# Altium schematic sheet STM32.SchDoc
size A4; SheetNumber: 4; SheetTotal: 6
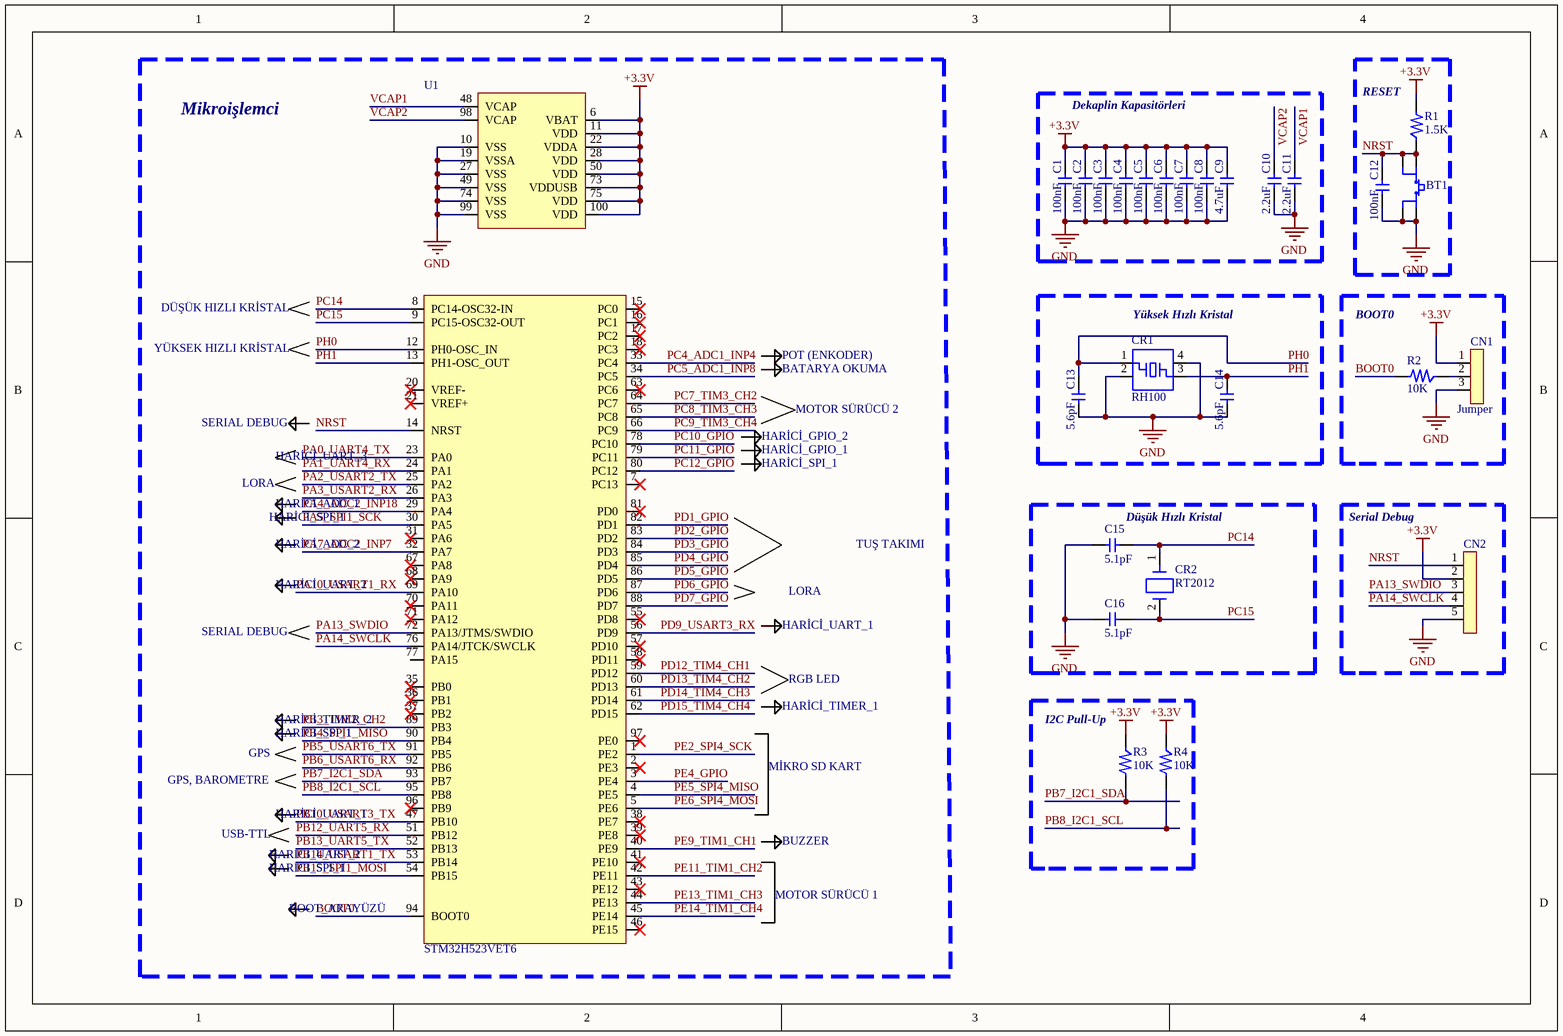
[diagram p0: STM32.SchDoc]

## Parts
BT1  5_mm_Buton  [5mm_buton]  (value not drawn)
C1  value 100nF  [CAP_0603]  (hidden comment: CAP_0603)
C2  value 100nF  [CAP_0603]  (hidden comment: CAP_0603)
C3  value 100nF  [CAP_0603]  (hidden comment: CAP_0603)
C4  value 100nF  [CAP_0603]  (hidden comment: CAP_0603)
C5  value 100nF  [CAP_0603]  (hidden comment: CAP_0603)
C6  value 100nF  [CAP_0603]  (hidden comment: CAP_0603)
C7  value 100nF  [CAP_0603]  (hidden comment: CAP_0603)
C8  value 100nF  [CAP_0603]  (hidden comment: CAP_0603)
C9  value 4.7uF  [CAP_0603]  (hidden comment: CAP_0603)
C10  value 2.2uF  [CAP_0603]  (hidden comment: CAP_0603)
C11  value 2.2uF  [CAP_0603]  (hidden comment: CAP_0603)
C12  value 100nF  [CAP_0603]  (hidden comment: CAP_0603)
C13  value 5.6pF  [CAP_0603]  (hidden comment: CAP_0603)
C14  value 5.6pF  [CAP_0603]  (hidden comment: CAP_0603)
C15  value 5.1pF  [CAP_0603]  (hidden comment: CAP_0603)
C16  value 5.1pF  [CAP_0603]  (hidden comment: CAP_0603)
CN1  Jumper  [3_PIN_HEADER]
CN2  5_Pin_Header  [5_PIN_HEADER]  (value not drawn)
CR1  RH100  [RH100]
CR2  RT2012  [RT2012]
R1  value 1.5K  [RES_0603]  (hidden comment: RES_0603)
R2  value 10K  [RES_0603]  (hidden comment: RES_0603)
R3  value 10K  [RES_0603]  (hidden comment: RES_0603)
R4  value 10K  [RES_0603]  (hidden comment: RES_0603)
U1  STM32H523VET6  [LQFP100]

## Blocks framed on the sheet
Mikroişlemci: U1

## Nets
+3.3V: C1.2 C2.2 C3.2 C4.2 C5.2 C6.2 C7.2 C8.2 C9.2 CN1.1 CN2.2 R1.1 R3.2 R4.2 U1.6(VBAT) U1.11(VDD) U1.22(VDDA) U1.28(VDD) U1.50(VDD) U1.73(VDDUSB) U1.75(VDD) U1.100(VDD)
GND: BT1.2 BT1.3 C1.1 C2.1 C3.1 C4.1 C5.1 C6.1 C7.1 C8.1 C9.1 C10.1 C11.1 C12.1 C13.1 C14.1 C15.2 C16.2 CN1.3 CN2.5 CR1.2 CR1.4 U1.10(VSS) U1.19(VSSA) U1.27(VSS) U1.49(VSS) U1.74(VSS) U1.99(VSS)
BOOT0: R2.1 U1.94(BOOT0)
NRST: BT1.1 BT1.4 C12.2 CN2.1 R1.2 U1.14(NRST)
PA0_UART4_TX: U1.23(PA0)
PA1_UART4_RX: U1.24(PA1)
PA2_USART2_TX: U1.25(PA2)
PA3_USART2_RX: U1.26(PA3)
PA4_ADC2_INP18: U1.29(PA4)
PA5_SPI1_SCK: U1.30(PA5)
PA7_ADC2_INP7: U1.32(PA7)
PA10_USART1_RX: U1.69(PA10)
PA13_SWDIO: CN2.3 U1.72(PA13/JTMS/SWDIO)
PA14_SWCLK: CN2.4 U1.76(PA14/JTCK/SWCLK)
PB3_TIM2_CH2: U1.89(PB3)
PB4_SPI1_MISO: U1.90(PB4)
PB5_USART6_TX: U1.91(PB5)
PB6_USART6_RX: U1.92(PB6)
PB7_I2C1_SDA: R3.1 U1.93(PB7)
PB8_I2C1_SCL: R4.1 U1.95(PB8)
PB10_USART3_TX: U1.47(PB10)
PB12_UART5_RX: U1.51(PB12)
PB13_UART5_TX: U1.52(PB13)
PB14_USART1_TX: U1.53(PB14)
PB15_SPI1_MOSI: U1.54(PB15)
PC4_ADC1_INP4: U1.33(PC4)
PC5_ADC1_INP8: U1.34(PC5)
PC7_TIM3_CH2: U1.64(PC7)
PC8_TIM3_CH3: U1.65(PC8)
PC9_TIM3_CH4: U1.66(PC9)
PC10_GPIO: U1.78(PC10)
PC11_GPIO: U1.79(PC11)
PC12_GPIO: U1.80(PC12)
PC14: C15.1 CR2.1 U1.8(PC14-OSC32-IN)
PC15: C16.1 CR2.2 U1.9(PC15-OSC32-OUT)
PD1_GPIO: U1.82(PD1)
PD2_GPIO: U1.83(PD2)
PD3_GPIO: U1.84(PD3)
PD4_GPIO: U1.85(PD4)
PD5_GPIO: U1.86(PD5)
PD6_GPIO: U1.87(PD6)
PD7_GPIO: U1.88(PD7)
PD9_USART3_RX: U1.56(PD9)
PD12_TIM4_CH1: U1.59(PD12)
PD13_TIM4_CH2: U1.60(PD13)
PD14_TIM4_CH3: U1.61(PD14)
PD15_TIM4_CH4: U1.62(PD15)
PE2_SPI4_SCK: U1.1(PE2)
PE4_GPIO: U1.3(PE4)
PE5_SPI4_MISO: U1.4(PE5)
PE6_SPI4_MOSI: U1.5(PE6)
PE9_TIM1_CH1: U1.40(PE9)
PE11_TIM1_CH2: U1.42(PE11)
PE13_TIM1_CH3: U1.44(PE13)
PE14_TIM1_CH4: U1.45(PE14)
PH0: C13.2 CR1.1 U1.12(PH0-OSC_IN)
PH1: C14.2 CR1.3 U1.13(PH1-OSC_OUT)
VCAP1: C11.2 U1.48(VCAP)
VCAP2: C10.2 U1.98(VCAP)
NetCN1_2: CN1.2 R2.2

Not connected (* = marked no-connect by the designer): U1 2(PE3)* 7(PC13)* 15(PC0)* 16(PC1)* 17(PC2)* 18(PC3)* 20(VREF-)* 21(VREF+)* 31(PA6)* 35(PB0)* 36(PB1)* 37(PB2)* 38(PE7)* 39(PE8)* 41(PE10)* 43(PE12)* 46(PE15)* 55(PD8)* 57(PD10)* 58(PD11)* 63(PC6)* 67(PA8)* 68(PA9)* 70(PA11)* 71(PA12)* 77(PA15) 81(PD0)* 96(PB9)* 97(PE0)*

## Notes on the sheet
- Dekaplin Kapasitörleri
- (near R1) RESET
- DÜŞÜK HIZLI KRİSTAL
- YÜKSEK HIZLI KRİSTAL
- BATARYA OKUMA
- POT (ENKODER)
- (near CR1) Yüksek Hızlı Kristal
- BOOT0
- SERIAL DEBUG
- HARİCİ_GPIO_2
- MOTOR SÜRÜCÜ 2
- LORA
- HARİCİ_SPI_1
- HARİCİ_ADC_1
- HARİCİ_UART_3
- HARİCİ_GPIO_1
- (near C15) Düşük Hızlı Kristal
- Serial Debug
- HARİCİ_ADC_2
- TUŞ TAKIMI
- HARİCİ_UART_2
- HARİCİ_UART_1
- HARİCİ_TIMER_1
- RGB LED
- GPS, BAROMETRE
- GPS
- HARİCİ_TIMER_2
- MİKRO SD KART
- (near R3) I2C Pull-Up
- USB-TTL
- BUZZER
- BOOT_ARAYÜZÜ
- MOTOR SÜRÜCÜ 1

## Library data of the parts
CN1 = 3_Pin_2.54mm
CN2 = 5_Pin_2.54mm
CR1 = 16_MHz_Crystal
CR2 = RT2012_Kristal